# Altium project MVP_Monitoreo.PrjPcb
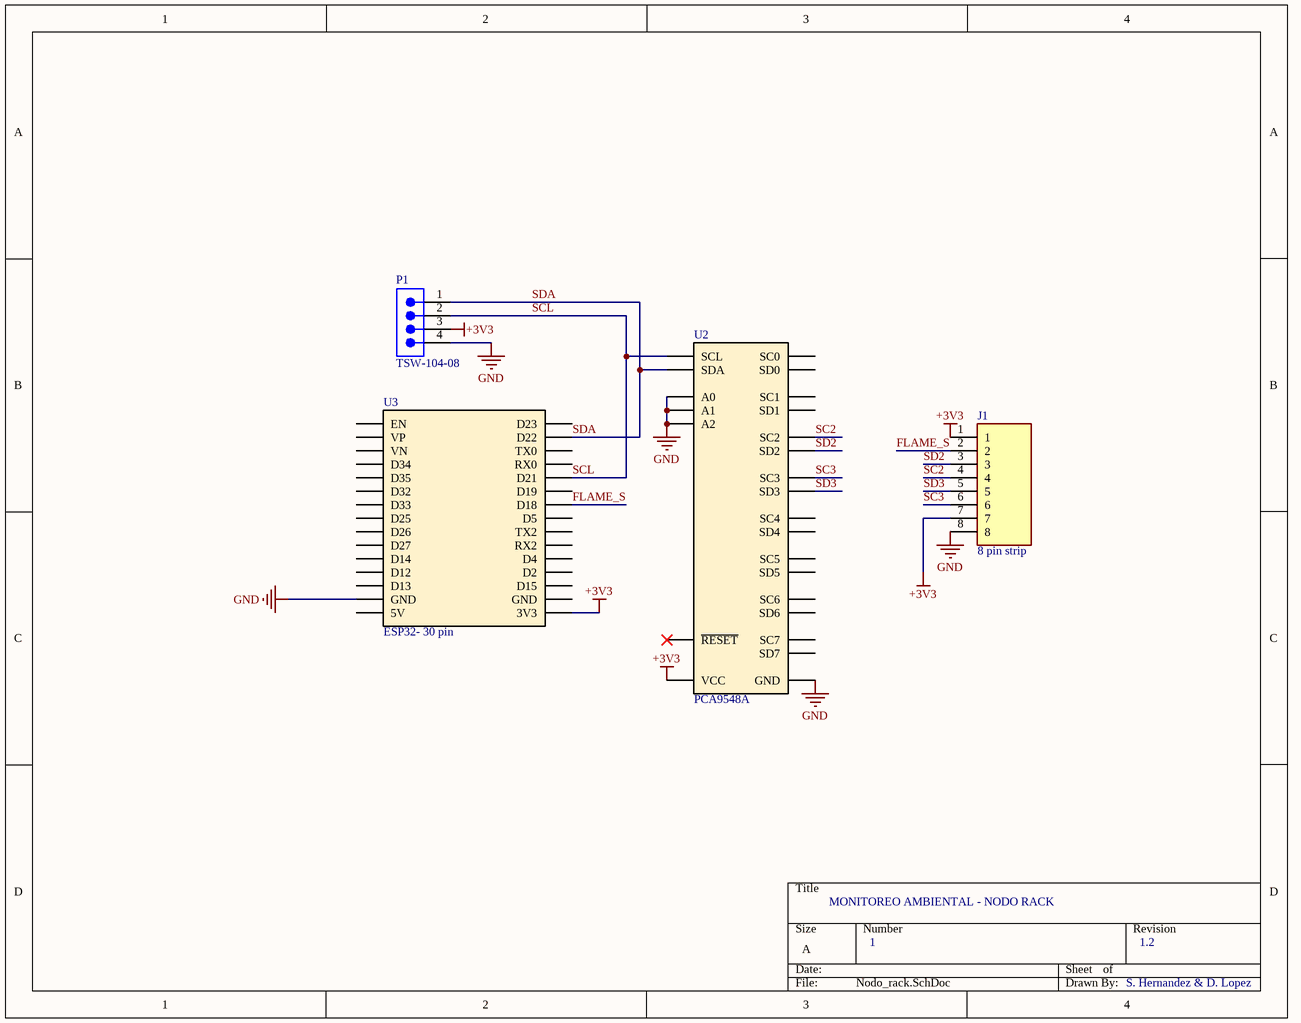
[diagram p0: Nodo_rack.SchDoc]
3 sheets, 12 parts. Net scope: global (net labels, ports and power ports of the same name join across sheets).
Board files: Nodo_rack_pcb.PcbDoc, Nodo_Sensores_pcb.PcbDoc, Nodo_Ambiente_pcb.PcbDoc
Sheets:
  Nodo_rack.SchDoc
  Nodo_Sensores.SchDoc
  Nodo_Ambiente.SchDoc

## Sheet Nodo_rack.SchDoc: Ambiental Monitoring | Rack-node
size A; Date: 13/10/2026; Author: Sebastian Hernandez & Diego Lopez; DocumentNumber: 1; Revision: 1.2; SheetNumber: 1; SheetTotal: 3

### Parts
J1  8 pin strip  [8 Pin_2.54mm]
P1  TSW-104-08  [SMTC-TSW-104-08-X-S]
U2  PCA9548A  [PCA9548A]
U3  ESP32- 30 pin  [ESP32 - 30 pin]

### Nets
+3V3: J1.1 J1.7 P1.3 U2.24(VCC) U3.16(3V3)
GND: J1.8 P1.4 U2.1(A0) U2.2(A1) U2.12(GND) U2.21(A2) U3.2(GND)
FLAME_S: J1.2 U3.24(D18)
SC2: J1.4 U2.9(SC2)
SC3: J1.6 U2.11(SC3)
SCL: P1.2 U2.22(SCL) U3.26(D21)
SD2: J1.3 U2.8(SD2)
SD3: J1.5 U2.10(SD3)
SDA: P1.1 U2.23(SDA) U3.29(D22)

Not connected (* = marked no-connect by the designer): U2 3(~{RESET})* 4(SD0) 5(SC0) 6(SD1) 7(SC1) 13(SD4) 14(SC4) 15(SD5) 16(SC5) 17(SD6) 18(SC6) 19(SD7) 20(SC7); U3 1(5V) 3(D13) 4(D12) 5(D14) 6(D27) 7(D26) 8(D25) 9(D33) 10(D32) 11(D35) 12(D34) 13(VN) 14(VP) 15(EN) 17(GND) 18(D15) 19(D2) 20(D4) 21(RX2) 22(TX2) 23(D5) 25(D19) 27(RX0) 28(TX0) 30(D23)

### Notes on the sheet
- MONITOREO AMBIENTAL - NODO RACK
- 1
- 1.2
- S. Hernandez & D. Lopez

### Library data of the parts
P1 = CMP-1024-00358-1: 0.025" SQ Post Header, Through-hole, Vertical, -55 to 125 degC, 2.54 mm Pitch, 4-Pin, Male, RoHS; PartNumber: TSW-104-08-L-S; Manufacturer: Samtec; Pitch: 2.54 mm; RoHS: True; Temperature Range: -55 to 125 degC; PackageDescription: .025[0.64] SQ. Post Terminal Strip Assembly; Orientation: Vertical; ComponentLink2URL: http://www.samtec.com/documents/webfiles/pdf/TSW_TH.PDF; ComponentLink1Description: Manufacturer URL; ComponentLink2Description: Datasheet; PackageVersion: DM, 8/1988; ComponentLink3URL: http://www.samtec.com/documents/webfiles/cpdf/TSW-XXX-XX-XXX-X-XX-XXX-MKT.pdf; Mounting Technology: Through-hole; PackageReference: TSW-104-08-X-S; ComponentLink3Description: Package Specification; ComponentLink1URL: http://www.samtec.com; DatasheetVersion: F-214

## Sheet Nodo_Sensores.SchDoc
size A; SheetNumber: 2; SheetTotal: 3
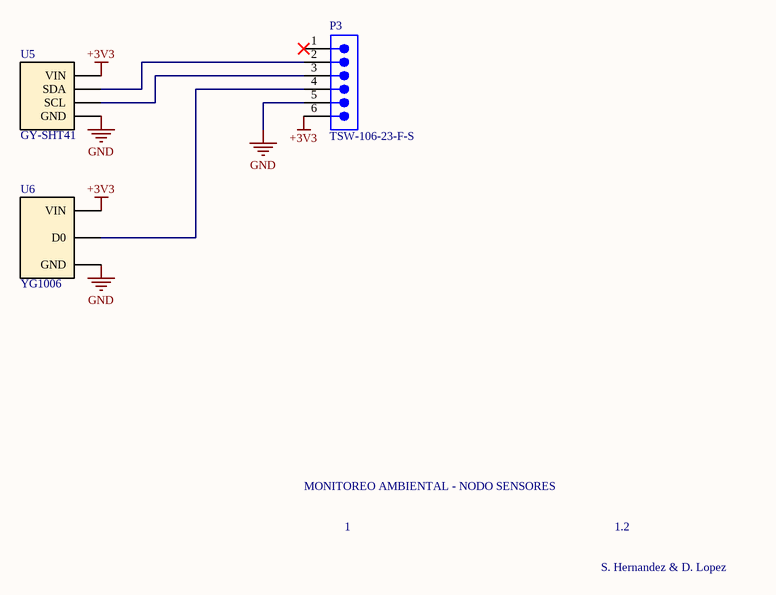
[diagram p1: Nodo_Sensores.SchDoc]

### Parts
P3  TSW-106-23-F-S  [SMTC-TSW-106-23-X-S]
U5  GY-SHT41  [SHT41]
U6  YG1006  [YG1006]

### Nets
+3V3: P3.6 U5.1(VIN) U6.1(VIN)
GND: P3.5 U5.2(GND) U6.2(GND)
NetP3_2: P3.2 U5.4(SDA)
NetP3_3: P3.3 U5.3(SCL)
NetP3_4: P3.4 U6.3(D0)

Not connected (* = marked no-connect by the designer): P3 1*

### Notes on the sheet
- MONITOREO AMBIENTAL - NODO SENSORES
- 1
- 1.2
- S. Hernandez & D. Lopez

### Library data of the parts
P3 = CMP-1024-00398-1: 0.025" SQ Post Header, Through-hole, Vertical, -55 to 125 degC, 2.54 mm Pitch, 6-Pin, Male, RoHS; Manufacturer: Samtec; Pitch: 2.54 mm; ComponentLink3Description: Package Specification; ComponentLink3URL: http://www.samtec.com/documents/webfiles/cpdf/TSW-XXX-XX-XXX-X-XX-XXX-MKT.pdf; Orientation: Vertical; ComponentLink1Description: Manufacturer URL; ComponentLink1URL: http://www.samtec.com; Mounting Technology: Through-hole; ComponentLink2URL: http://www.samtec.com/documents/webfiles/pdf/TSW_TH.PDF; PackageDescription: .025[0.64] SQ. Post Terminal Strip Assembly; PartNumber: TSW-106-23-F-S; DatasheetVersion: F-214; PackageVersion: DM, 8/1988; Temperature Range: -55 to 125 degC; ComponentLink2Description: Datasheet; RoHS: True; PackageReference: TSW-106-23-X-S

## Sheet Nodo_Ambiente.SchDoc
size A; SheetNumber: 3; SheetTotal: 3
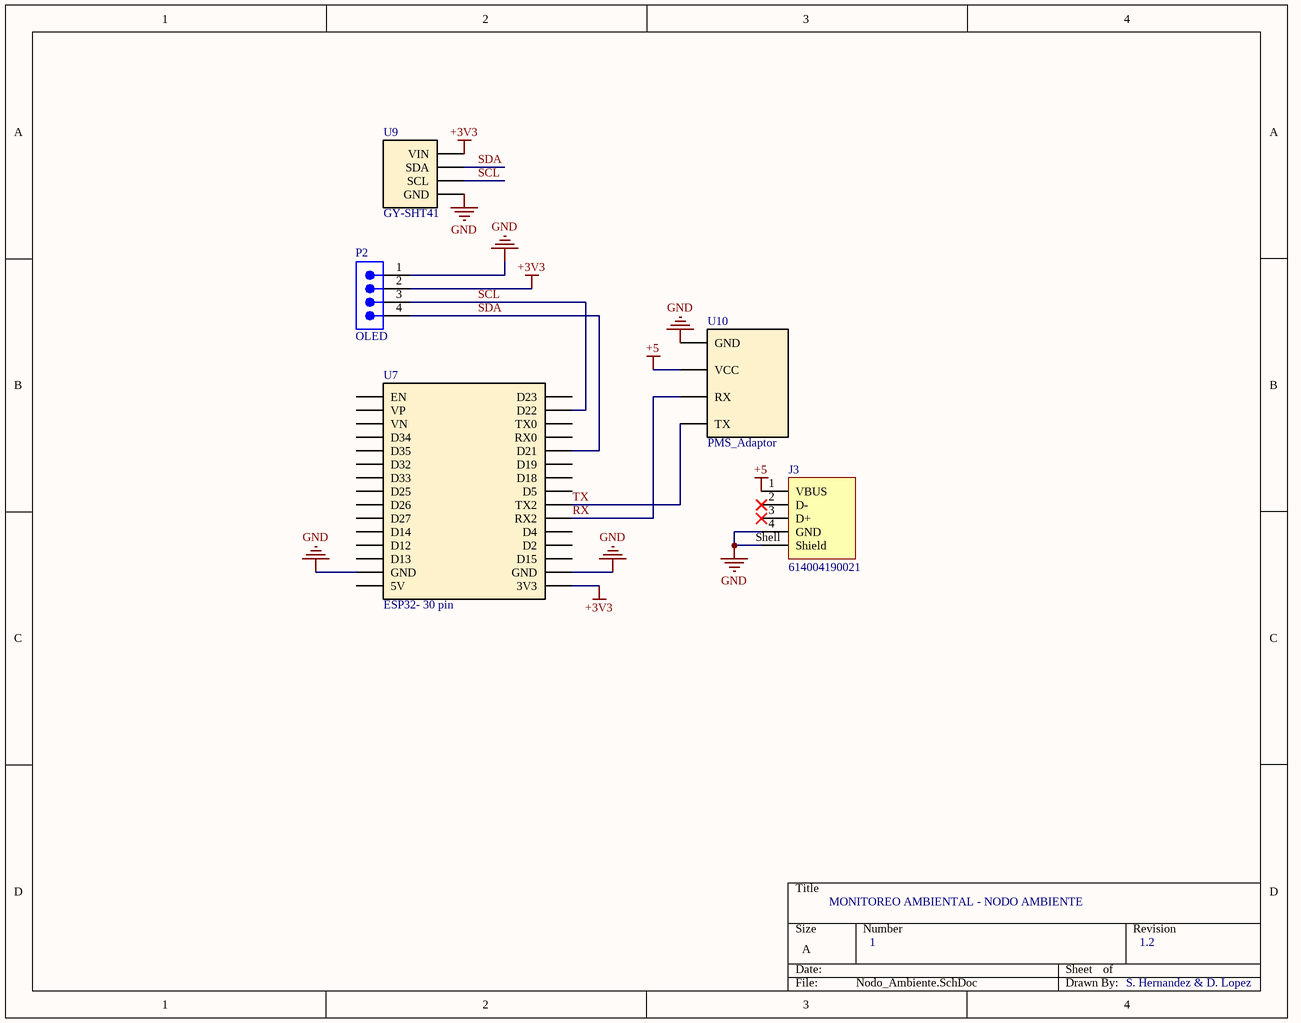
[diagram p2: Nodo_Ambiente.SchDoc]

### Parts
J3  614004190021  [614004190021]
P2  OLED  [SMTC-TSW-104-08-X-S]
U7  ESP32- 30 pin  [ESP32 - 30 pin]
U9  GY-SHT41  [SHT41]
U10  PMS_Adaptor  [PMS_Adaptor]

### Nets
+3V3: P2.2 U7.16(3V3) U9.1(VIN)
+5: J3.1(VBUS) U10.3(VCC)
GND: J3.4(GND) J3.Shell(Shield) P2.1 U7.2(GND) U7.17(GND) U9.2(GND) U10.4(GND)
RX: U7.21(RX2) U10.2(RX)
SCL: P2.3 U7.29(D22) U9.3(SCL)
SDA: P2.4 U7.26(D21) U9.4(SDA)
TX: U7.22(TX2) U10.1(TX)

Not connected (* = marked no-connect by the designer): J3 2(D-)* 3(D+)*; U7 1(5V) 3(D13) 4(D12) 5(D14) 6(D27) 7(D26) 8(D25) 9(D33) 10(D32) 11(D35) 12(D34) 13(VN) 14(VP) 15(EN) 18(D15) 19(D2) 20(D4) 23(D5) 24(D18) 25(D19) 27(RX0) 28(TX0) 30(D23)

### Notes on the sheet
- MONITOREO AMBIENTAL - NODO AMBIENTE
- 1
- 1.2
- S. Hernandez & D. Lopez

### Library data of the parts
J3 = CMP-1502-03228-3: USB Connector, 2.0 TYPE A, RECEPTACLE, THT; Connector Type: USB Type A; Standard: USB 2.0; Gender: Receptacle; No. of...; USB Standard: USB 2.0; Insulation Resistance: 1GΩ; Current Rating: 3A; Number of Contacts: 4; Operating Supply Voltage: 30V; Contact Resistance: 30mΩ; Housing Color: White; Contact Material: Brass; Orientation: Horizontal; Connector Type: USB; Max Operating Temperature: 85°C; Contact Plating: Gold; Number of Pins: 4; REACH SVHC: No; Insulation Material: PBT; Min Operating Temperature: -40°C; Mount: Horizontal, Through Hole; RoHS: Compliant
P2 = CMP-1024-00358-1: as P1 on sheet Nodo_rack; RoHS: True; Temperature Range: -55 to 125 degC; PackageDescription: .025[0.64] SQ. Post Terminal Strip Assembly; Orientation: Vertical; ComponentLink2URL: http://www.samtec.com/documents/webfiles/pdf/TSW_TH.PDF; ComponentLink1Description: Manufacturer URL; ComponentLink2Description: Datasheet; PackageVersion: DM, 8/1988; ComponentLink3URL: http://www.samtec.com/documents/webfiles/cpdf/TSW-XXX-XX-XXX-X-XX-XXX-MKT.pdf; Mounting Technology: Through-hole; PackageReference: TSW-104-08-X-S; ComponentLink3Description: Package Specification; ComponentLink1URL: http://www.samtec.com; DatasheetVersion: F-214

## Nets that join several sheets
+3V3: Nodo_rack (5 pins), Nodo_Sensores (P3.6 U5.1 U6.1), Nodo_Ambiente (P2.2 U7.16 U9.1)
GND: Nodo_rack (7 pins), Nodo_Sensores (P3.5 U5.2 U6.2), Nodo_Ambiente (7 pins)
SCL: Nodo_rack (P1.2 U2.22 U3.26), Nodo_Ambiente (P2.3 U7.29 U9.3)
SDA: Nodo_rack (P1.1 U2.23 U3.29), Nodo_Ambiente (P2.4 U7.26 U9.4)